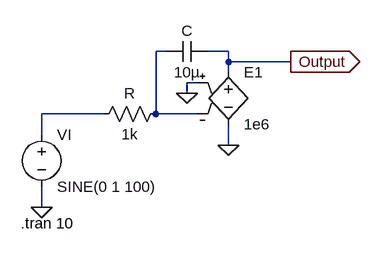
[diagram p0: schematic miller-integrator-100Hz.asc]
miller-integrator-100Hz.asc, the LTspice schematic file:
Version 4.1
SHEET 1 880 680
WIRE 112 80 96 80
WIRE 208 80 176 80
WIRE 208 96 208 80
WIRE 304 96 208 96
WIRE 208 112 208 96
WIRE 160 128 144 128
WIRE 144 144 144 128
WIRE 16 176 -80 176
WIRE 96 176 96 80
WIRE 160 176 96 176
WIRE -80 208 -80 176
WIRE 208 224 208 192
WIRE -80 320 -80 288
FLAG 144 144 0
FLAG 208 224 0
FLAG -80 320 0
FLAG 304 96 Output
IOPIN 304 96 Out
SYMBOL e 208 96 R0
SYMATTR InstName E1
SYMATTR Value 1e6
SYMBOL res 112 160 R90
WINDOW 0 0 56 VBottom 2
WINDOW 3 32 56 VTop 2
SYMATTR InstName R
SYMATTR Value 1k
SYMBOL cap 176 64 R90
WINDOW 0 0 32 VBottom 2
WINDOW 3 32 32 VTop 2
SYMATTR InstName C
SYMATTR Value 10µ
SYMBOL voltage -80 192 R0
WINDOW 123 0 0 Left 0
WINDOW 39 0 0 Left 0
SYMATTR InstName VI
SYMATTR Value SINE(0 1 100)
TEXT -112 344 Left 2 !.tran 10

The netlist it stands for:
* miller-integrator-100Hz.asc
E1 Output 0 0 N001 1e6
R N001 N002 1k
C Output N001 10µ
VI N002 0 SINE(0 1 100)
.tran 10
.backanno
.end